# Altium schematic sheet Top_Sheet.SchDoc
size A4
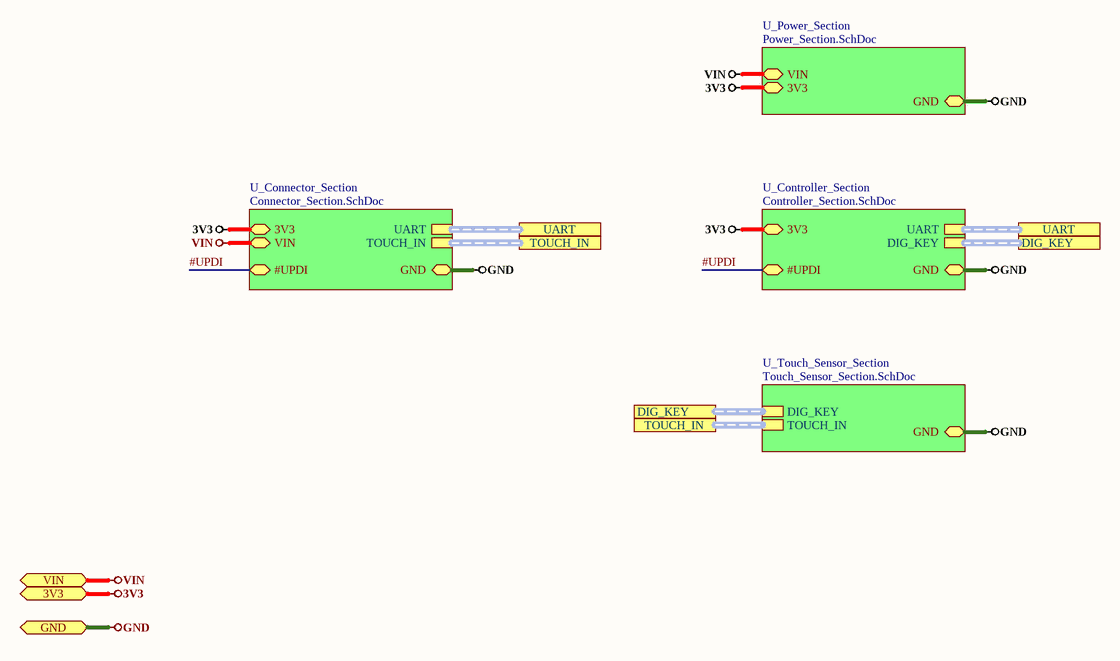
[diagram p0: Top_Sheet.SchDoc]

## Sub-sheets
U_Connector_Section = Connector_Section.SchDoc: 3V3 (bidir), GND (bidir), UART (harness UART_Harness), #UPDI (bidir), TOUCH_IN (harness Touch_Harness), VIN (bidir)
U_Controller_Section = Controller_Section.SchDoc: 3V3 (bidir), GND (bidir), UART (harness UART_Harness), #UPDI (bidir), DIG_KEY (harness Cap_Harness)
U_Power_Section = Power_Section.SchDoc: VIN (bidir), GND (bidir), 3V3 (bidir)
U_Touch_Sensor_Section = Touch_Sensor_Section.SchDoc: GND (bidir), DIG_KEY (harness Cap_Harness), TOUCH_IN (harness Touch_Harness)

## Ports
3V3 (bidir), DIG_KEY (harness Cap_Harness), GND (bidir), TOUCH_IN (harness Touch_Harness), UART (harness UART_Harness), VIN (bidir)

## Nets
3V3: port 3V3, sheet U_Connector_Section/3V3, sheet U_Controller_Section/3V3, sheet U_Power_Section/3V3
GND: port GND, sheet U_Connector_Section/GND, sheet U_Controller_Section/GND, sheet U_Power_Section/GND, sheet U_Touch_Sensor_Section/GND
VIN: port VIN, sheet U_Connector_Section/VIN, sheet U_Power_Section/VIN
#UPDI: sheet U_Connector_Section/#UPDI, sheet U_Controller_Section/#UPDI

## Buses and harness runs
harness port DIG_KEY = sheet U_Controller_Section/DIG_KEY
harness port DIG_KEY = sheet U_Touch_Sensor_Section/DIG_KEY
harness port TOUCH_IN = sheet U_Connector_Section/TOUCH_IN
harness port TOUCH_IN = sheet U_Touch_Sensor_Section/TOUCH_IN
harness port UART = sheet U_Connector_Section/UART
harness port UART = sheet U_Controller_Section/UART